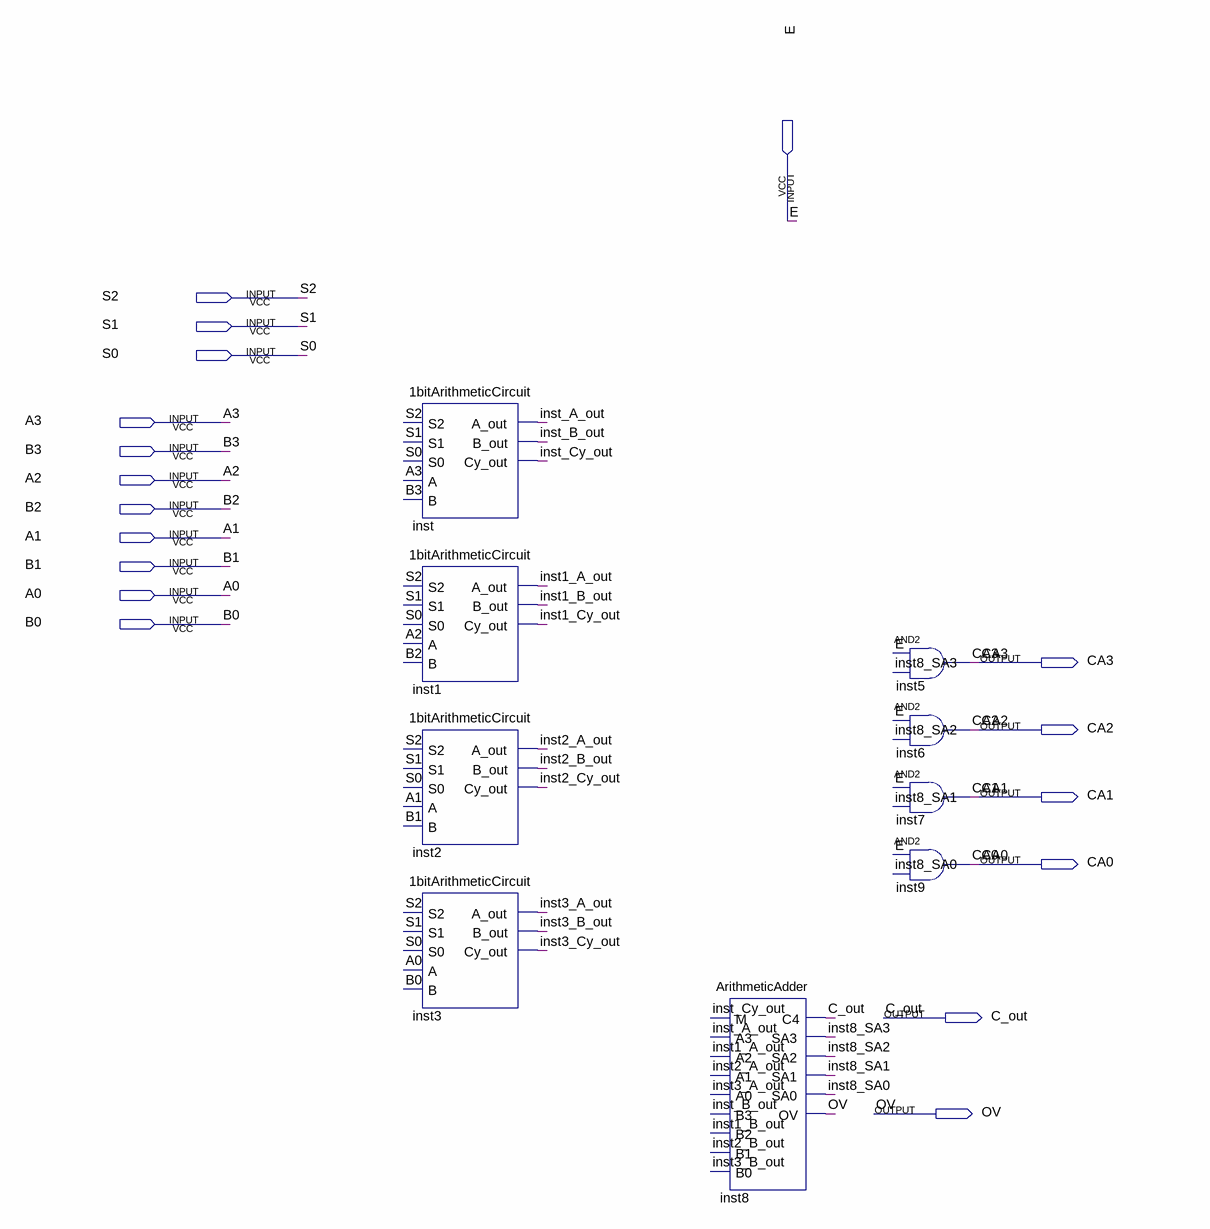
[diagram p0: schematic sheet]
// Quartus schematic 4bitArithmeticCircuit.bdf as structural Verilog: 9 symbols, 18 pins
module \4bitArithmeticCircuit  (
  input  E,
  input  S2,
  input  S1,
  input  S0,
  input  A3,
  input  B3,
  input  A2,
  input  B2,
  input  A1,
  input  B1,
  input  A0,
  input  B0,
  output CA3,
  output CA2,
  output CA1,
  output CA0,
  output C_out,
  output OV
);

  wire inst1_A_out, inst1_B_out, inst1_Cy_out, inst2_A_out, inst2_B_out, inst2_Cy_out, inst3_A_out,
       inst3_B_out, inst3_Cy_out, inst8_SA0, inst8_SA1, inst8_SA2, inst8_SA3, inst_A_out, inst_B_out,
       inst_Cy_out;

  \1bitArithmeticCircuit  inst (
    .S2(S2), .S1(S1), .S0(S0), .A(A3), .B(B3), .A_out(inst_A_out), .B_out(inst_B_out), .Cy_out(inst_Cy_out));
  \1bitArithmeticCircuit  inst1 (
    .S2(S2), .S1(S1), .S0(S0), .A(A2), .B(B2), .A_out(inst1_A_out), .B_out(inst1_B_out), .Cy_out(inst1_Cy_out));
  \1bitArithmeticCircuit  inst2 (
    .S2(S2), .S1(S1), .S0(S0), .A(A1), .B(B1), .A_out(inst2_A_out), .B_out(inst2_B_out), .Cy_out(inst2_Cy_out));
  \1bitArithmeticCircuit  inst3 (
    .S2(S2), .S1(S1), .S0(S0), .A(A0), .B(B0), .A_out(inst3_A_out), .B_out(inst3_B_out), .Cy_out(inst3_Cy_out));
  ArithmeticAdder inst8 (
    .M(inst_Cy_out), .A3(inst_A_out), .A2(inst1_A_out), .A1(inst2_A_out), .A0(inst3_A_out), .B3(inst_B_out),
    .B2(inst1_B_out), .B1(inst2_B_out), .B0(inst3_B_out), .C4(C_out), .SA3(inst8_SA3), .SA2(inst8_SA2),
    .SA1(inst8_SA1), .SA0(inst8_SA0), .OV(OV));
  and inst5 (CA3, E, inst8_SA3);
  and inst6 (CA2, E, inst8_SA2);
  and inst7 (CA1, E, inst8_SA1);
  and inst9 (CA0, E, inst8_SA0);
endmodule
